# Altium schematic sheet FPGAPower&Misc.SchDoc: =DocumentName
size A3; EDA_Number: ARTIQ; Projet: ARTIQ/SINARA; ModifiedBy: -; CheckedDate: -; Title2: FPGA Power&Misc; DivGrp: WUT ISE; Designer: F.Świtakowski; DocumentNumber: 10; Revision: 0; SheetNumber: 10; SheetTotal: 17
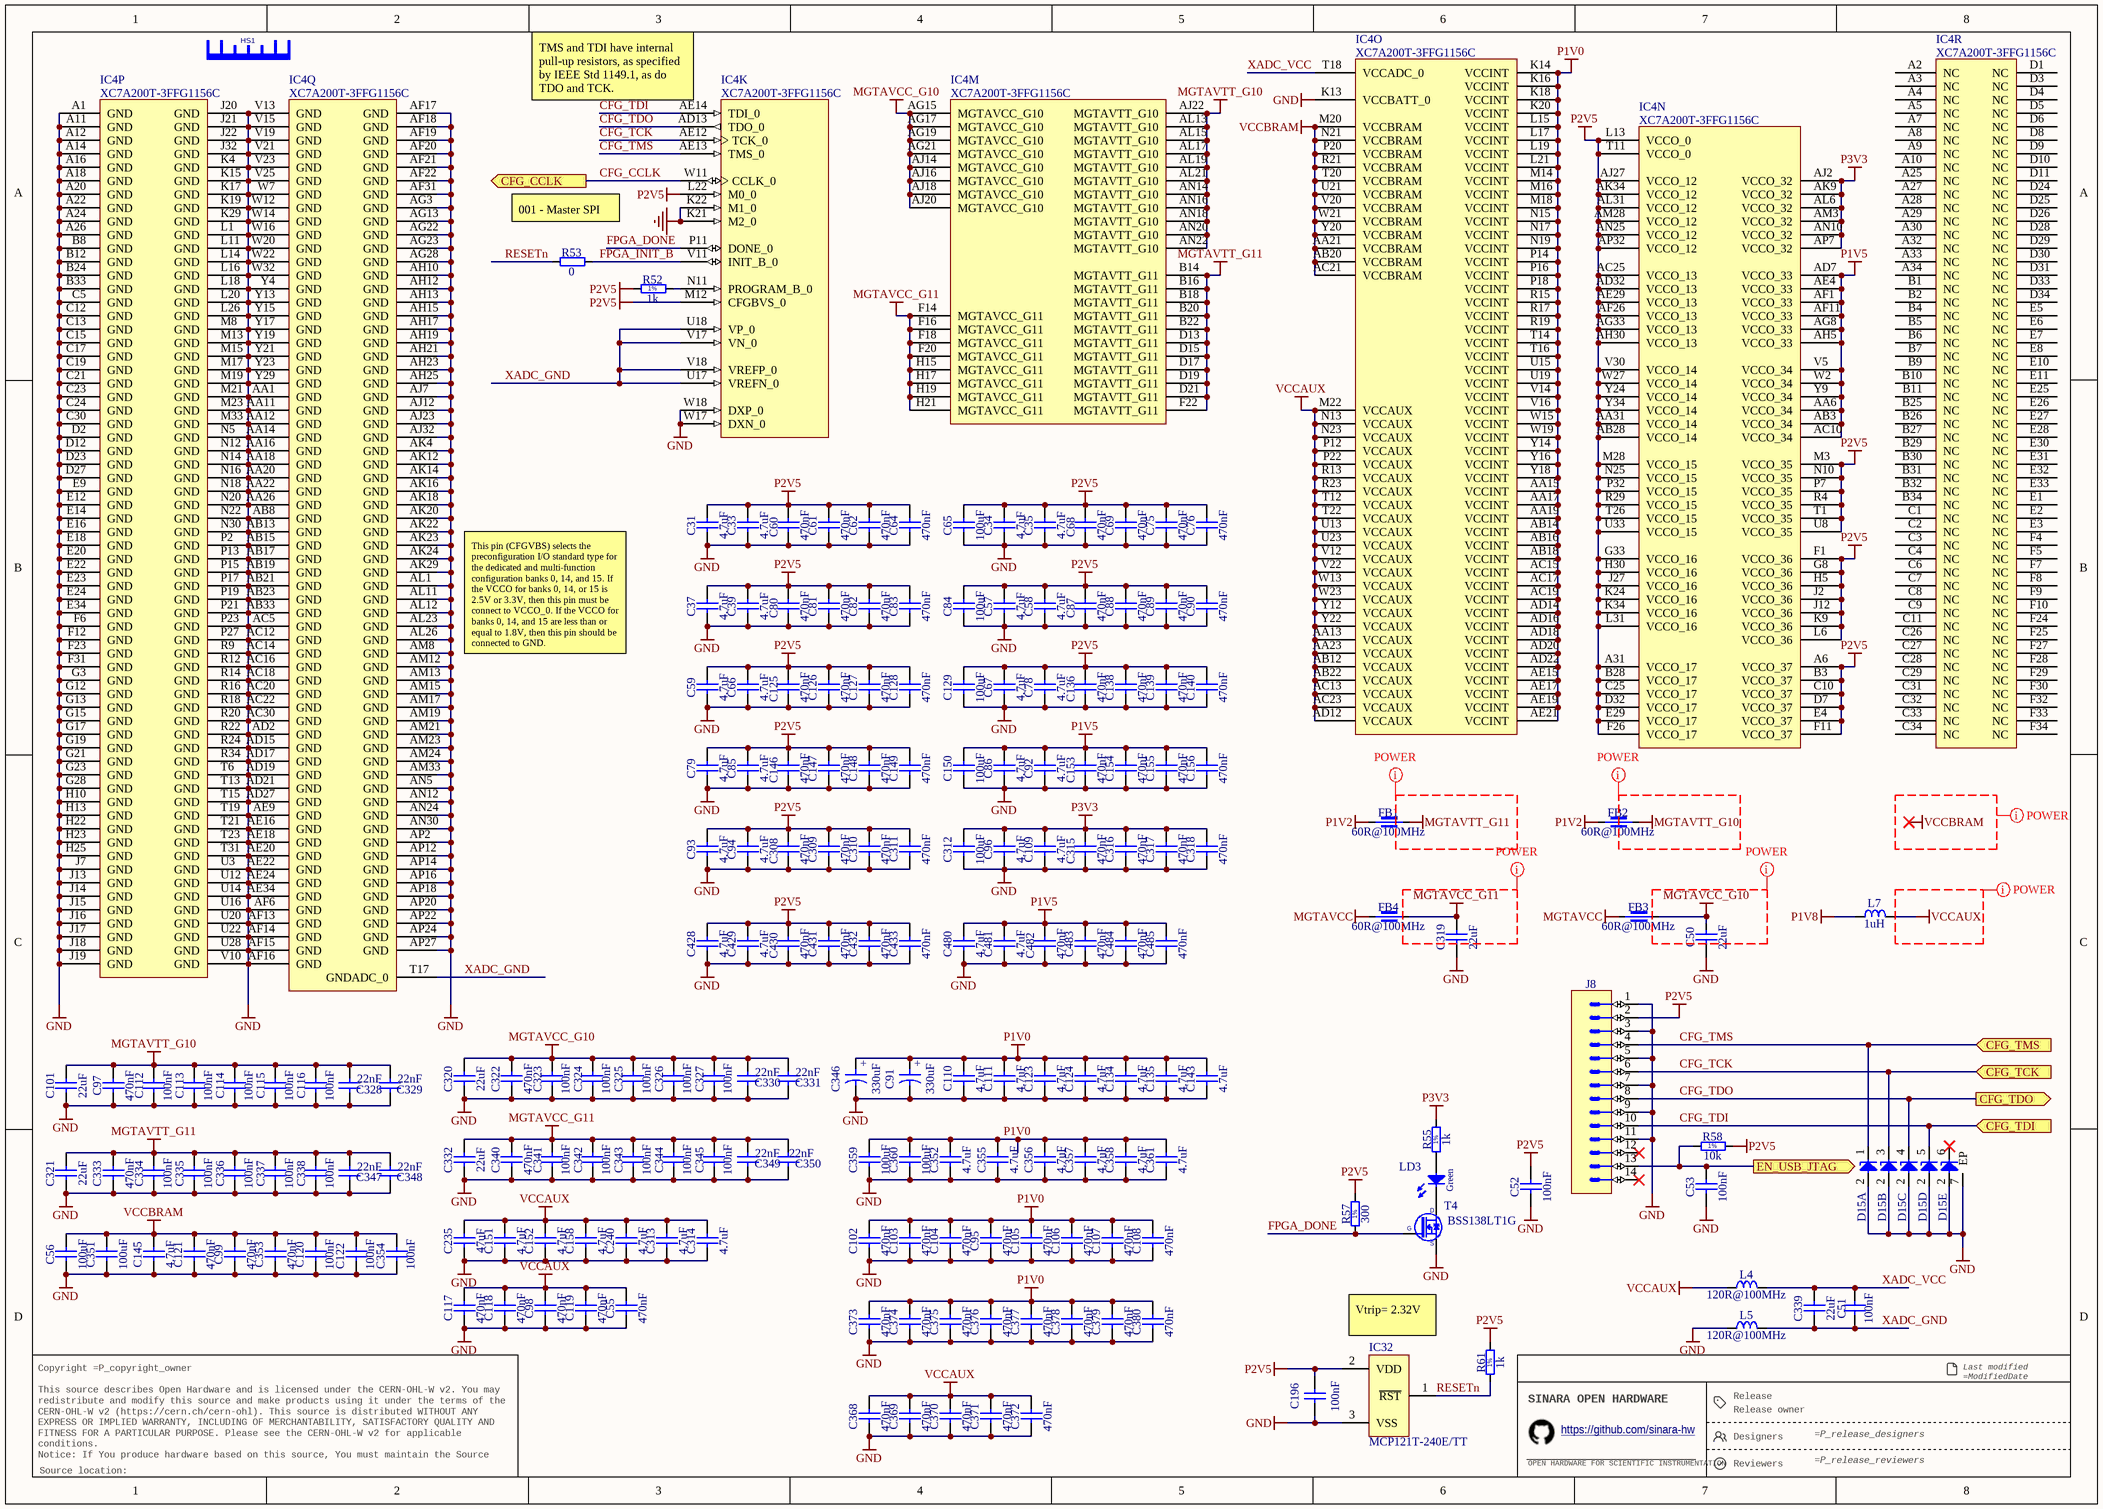
[diagram p0: FPGAPower&Misc.SchDoc]

## Parts
C31  4.7uF  [CAPC1005X55N]
C33  4.7uF  [CAPC1005X55N]
C34  4.7uF  [CAPC1005X55N]
C35  4.7uF  [CAPC1005X55N]
C37  4.7uF  [CAPC1005X55N]
C39  4.7uF  [CAPC1005X55N]
C50  22uF  [CAPC1608X90N]
C51  100nF  [CAPC0603X33N]
C52  100nF  [CAPC1005X55N]
C53  100nF  [CAPC1005X55N]
C55  470nF  [CAPC0603X33N]
C56  100uF  [CAPC3225X270N]
C57  4.7uF  [CAPC1005X55N]
C58  4.7uF  [CAPC1005X55N]
C59  4.7uF  [CAPC1005X55N]
C60  470nF  [CAPC0603X33N]
C61  470nF  [CAPC0603X33N]
C62  470nF  [CAPC0603X33N]
C64  470nF  [CAPC0603X33N]
C65  100uF  [CAPC3225X270N]
C66  4.7uF  [CAPC1005X55N]
C67  4.7uF  [CAPC1005X55N]
C68  470nF  [CAPC0603X33N]
C69  470nF  [CAPC0603X33N]
C75  470nF  [CAPC0603X33N]
C76  470nF  [CAPC0603X33N]
C78  4.7uF  [CAPC1005X55N]
C79  4.7uF  [CAPC1005X55N]
C80  470nF  [CAPC0603X33N]
C81  470nF  [CAPC0603X33N]
C82  470nF  [CAPC0603X33N]
C83  470nF  [CAPC0603X33N]
C84  100uF  [CAPC3225X270N]
C85  4.7uF  [CAPC1005X55N]
C86  4.7uF  [CAPC1005X55N]
C87  470nF  [CAPC0603X33N]
C88  470nF  [CAPC0603X33N]
C89  470nF  [CAPC0603X33N]
C90  470nF  [CAPC0603X33N]
C91  330uF  [CAPMP7343X190N]
C92  4.7uF  [CAPC1005X55N]
C93  4.7uF  [CAPC1005X55N]
C94  4.7uF  [CAPC1005X55N]
C95  470nF  [CAPC0603X33N]
C96  4.7uF  [CAPC1005X55N]
C97  470nF  [CAPC0603X33N]
C98  470nF  [CAPC0603X33N]
C99  470nF  [CAPC0603X33N]
C101  22uF  [CAPC1709X100N]
C102  470nF  [CAPC0603X33N]
C103  470nF  [CAPC0603X33N]
C104  470nF  [CAPC0603X33N]
C105  470nF  [CAPC0603X33N]
C106  470nF  [CAPC0603X33N]
C107  470nF  [CAPC0603X33N]
C108  470nF  [CAPC0603X33N]
C109  4.7uF  [CAPC1005X55N]
C110  4.7uF  [CAPC1005X55N]
C111  4.7uF  [CAPC1005X55N]
C112  100nF  [CAPC0603X33N]
C113  100nF  [CAPC0603X33N]
C114  100nF  [CAPC0603X33N]
C115  100nF  [CAPC0603X33N]
C116  100nF  [CAPC0603X33N]
C117  470nF  [CAPC0603X33N]
C118  470nF  [CAPC0603X33N]
C119  470nF  [CAPC0603X33N]
C120  100nF  [CAPC0603X33N]
C121  470nF  [CAPC0603X33N]
C122  100nF  [CAPC0603X33N]
C123  4.7uF  [CAPC1005X55N]
C124  4.7uF  [CAPC1005X55N]
C125  470nF  [CAPC0603X33N]
C126  470nF  [CAPC0603X33N]
C127  470nF  [CAPC0603X33N]
C128  470nF  [CAPC0603X33N]
C129  100uF  [CAPC3225X270N]
C134  4.7uF  [CAPC1005X55N]
C135  4.7uF  [CAPC1005X55N]
C136  470nF  [CAPC0603X33N]
C138  470nF  [CAPC0603X33N]
C139  470nF  [CAPC0603X33N]
C140  470nF  [CAPC0603X33N]
C143  4.7uF  [CAPC1005X55N]
C145  4.7uF  [CAPC1005X55N]
C146  470nF  [CAPC0603X33N]
C147  470nF  [CAPC0603X33N]
C148  470nF  [CAPC0603X33N]
C149  470nF  [CAPC0603X33N]
C150  100uF  [CAPC3225X270N]
C151  4.7uF  [CAPC1005X55N]
C152  4.7uF  [CAPC1005X55N]
C153  470nF  [CAPC0603X33N]
C154  470nF  [CAPC0603X33N]
C155  470nF  [CAPC0603X33N]
C156  470nF  [CAPC0603X33N]
C158  4.7uF  [CAPC1005X55N]
C196  100nF  [CAPC1005X55N]
C235  47uF  [CAPC3225X270N]
C240  4.7uF  [CAPC1005X55N]
C308  470nF  [CAPC0603X33N]
C309  470nF  [CAPC0603X33N]
C310  470nF  [CAPC0603X33N]
C311  470nF  [CAPC0603X33N]
C312  100uF  [CAPC3225X270N]
C313  4.7uF  [CAPC1005X55N]
C314  4.7uF  [CAPC1005X55N]
C315  470nF  [CAPC0603X33N]
C316  470nF  [CAPC0603X33N]
C317  470nF  [CAPC0603X33N]
C318  470nF  [CAPC0603X33N]
C319  22uF  [CAPC1608X90N]
C320  22uF  [CAPC1608X90N]
C321  22uF  [CAPC1608X90N]
C322  470nF  [CAPC0603X33N]
C323  100nF  [CAPC0603X33N]
C324  100nF  [CAPC0603X33N]
C325  100nF  [CAPC0603X33N]
C326  100nF  [CAPC0603X33N]
C327  100nF  [CAPC0603X33N]
C328  22nF  [CAPC0603X33N]
C329  22nF  [CAPC0603X33N]
C330  22nF  [CAPC0603X33N]
C331  22nF  [CAPC0603X33N]
C332  22uF  [CAPC1608X90N]
C333  470nF  [CAPC0603X33N]
C334  100nF  [CAPC0603X33N]
C335  100nF  [CAPC0603X33N]
C336  100nF  [CAPC0603X33N]
C337  100nF  [CAPC0603X33N]
C338  100nF  [CAPC0603X33N]
C339  22uF  [CAPC1608X90N]
C340  470nF  [CAPC0603X33N]
C341  100nF  [CAPC0603X33N]
C342  100nF  [CAPC0603X33N]
C343  100nF  [CAPC0603X33N]
C344  100nF  [CAPC0603X33N]
C345  100nF  [CAPC0603X33N]
C346  330uF  [CAPMP7343X190N]
C347  22nF  [CAPC0603X33N]
C348  22nF  [CAPC0603X33N]
C349  22nF  [CAPC0603X33N]
C350  22nF  [CAPC0603X33N]
C351  100uF  [CAPC3225X270N]
C352  4.7uF  [CAPC1005X55N]
C353  470nF  [CAPC0603X33N]
C354  100nF  [CAPC0603X33N]
C355  4.7uF  [CAPC1005X55N]
C356  4.7uF  [CAPC1005X55N]
C357  4.7uF  [CAPC1005X55N]
C358  4.7uF  [CAPC1005X55N]
C359  100uF  [CAPC3225X270N]
C360  100uF  [CAPC3225X270N]
C361  4.7uF  [CAPC1005X55N]
C368  470nF  [CAPC0603X33N]
C369  470nF  [CAPC0603X33N]
C370  470nF  [CAPC0603X33N]
C371  470nF  [CAPC0603X33N]
C372  470nF  [CAPC0603X33N]
C373  470nF  [CAPC0603X33N]
C374  470nF  [CAPC0603X33N]
C375  470nF  [CAPC0603X33N]
C376  470nF  [CAPC0603X33N]
C377  470nF  [CAPC0603X33N]
C378  470nF  [CAPC0603X33N]
C379  470nF  [CAPC0603X33N]
C380  470nF  [CAPC0603X33N]
C428  4.7uF  [CAPC1005X55N]
C429  4.7uF  [CAPC1005X55N]
C430  470nF  [CAPC0603X33N]
C431  470nF  [CAPC0603X33N]
C432  470nF  [CAPC0603X33N]
C433  470nF  [CAPC0603X33N]
C480  4.7uF  [CAPC1005X55N]
C481  4.7uF  [CAPC1005X55N]
C482  470nF  [CAPC0603X33N]
C483  470nF  [CAPC0603X33N]
C484  470nF  [CAPC0603X33N]
C485  470nF  [CAPC0603X33N]
D15  UCLAMP3305P.TCT  [SON50P160X65_HS-7N]  (value not drawn)  (parts A,B,C,D,E of 5)
FB1  60R@100MHz  [INDC4516X180N]
FB2  60R@100MHz  [INDC4516X180N]
FB3  60R@100MHz  [INDC4516X180N]
FB4  60R@100MHz  [INDC4516X180N]
HS1  Heat Sink No Pad  [HSINK_ATS_ATS-50350B-C1-R0]  (value not drawn)
IC4  XC7A200T-3FFG1156C  [BGA1156C100P34X34_3500X3500X310]  (parts K,M,N,O,P,Q,R of 18)
IC32  MCP121T-240E/TT  [SOT-23-TT3_L]
J8  Milli-Grid™  [MOLEX_87832-1420]  (value not drawn)
L4  120R@100MHz  [INDC1608X65N]
L5  120R@100MHz  [INDC1608X65N]
L7  1uH  [IND_BOURNS_SRN3015]
LD3  Green  [LED_KINGBRIGHT_KPH-1608CGCK]
R52  1k  [RESC1005X40N]
R53  0  [RESC1005X40N]
R55  1k  [RESC1005X40N]
R57  300  [RESC1005X40N]
R58  10k  [RESC1005X40N]
R61  1k  [RESC1005X40N]
T4  BSS138LT1G  [SOT95P240X110-3N]

## Ports
CFG_CCLK (out), CFG_TCK (in), CFG_TDI (in), CFG_TDO (out), CFG_TMS (in), EN_USB_JTAG (out)

## Nets
GND: C31.1 C33.1 C34.1 C35.1 C37.1 C39.1 C50.1 C52.1 C53.1 C55.1 C56.1 C57.1 C58.1 C59.1 C60.1 C61.1 C62.1 C64.1 C65.1 C66.1 C67.1 C68.1 C69.1 C75.1 C76.1 C78.1 C79.1 C80.1 C81.1 C82.1 C83.1 C84.1 C85.1 C86.1 C87.1 C88.1 C89.1 C90.1 C91.2 C92.1 C93.1 C94.1 C95.1 C96.1 C97.1 C98.1 C99.1 C101.1 C102.1 C103.1 C104.1 C105.1 C106.1 C107.1 C108.1 C109.1 C110.1 C111.1 C112.1 C113.1 C114.1 C115.1 C116.1 C117.1 C118.1 C119.1 C120.1 C121.1 C122.1 C123.1 C124.1 C125.1 C126.1 C127.1 C128.1 C129.1 C134.1 C135.1 C136.1 C138.1 C139.1 C140.1 C143.1 C145.1 C146.1 C147.1 C148.1 C149.1 C150.1 C151.1 C152.1 C153.1 C154.1 C155.1 C156.1 C158.1 C196.1 C235.1 C240.1 C308.1 C309.1 C310.1 C311.1 C312.1 C313.1 C314.1 C315.1 C316.1 C317.1 C318.1 C319.1 C320.1 C321.1 C322.1 C323.1 C324.1 C325.1 C326.1 C327.1 C328.1 C329.1 C330.1 C331.1 C332.1 C333.1 C334.1 C335.1 C336.1 C337.1 C338.1 C340.1 C341.1 C342.1 C343.1 C344.1 C345.1 C346.2 C347.1 C348.1 C349.1 C350.1 C351.1 C352.1 C353.1 C354.1 C355.1 C356.1 C357.1 C358.1 C359.1 C360.1 C361.1 C368.1 C369.1 C370.1 C371.1 C372.1 C373.1 C374.1 C375.1 C376.1 C377.1 C378.1 C379.1 C380.1 C428.1 C429.1 C430.1 C431.1 C432.1 C433.1 C480.1 C481.1 C482.1 C483.1 C484.1 C485.1 D15.2(A) D15.7(EP) IC4.A1(GND) IC4.A11(GND) IC4.A12(GND) IC4.A14(GND) IC4.A16(GND) IC4.A18(GND) IC4.A20(GND) IC4.A22(GND) IC4.A24(GND) IC4.A26(GND) IC4.AA1(GND) IC4.AA11(GND) IC4.AA12(GND) IC4.AA14(GND) IC4.AA16(GND) IC4.AA18(GND) IC4.AA20(GND) IC4.AA22(GND) IC4.AA26(GND) IC4.AB8(GND) IC4.AB13(GND) IC4.AB15(GND) IC4.AB17(GND) IC4.AB19(GND) IC4.AB21(GND) IC4.AB23(GND) IC4.AB33(GND) IC4.AC5(GND) IC4.AC12(GND) IC4.AC14(GND) IC4.AC16(GND) IC4.AC18(GND) IC4.AC20(GND) IC4.AC22(GND) IC4.AC30(GND) IC4.AD2(GND) IC4.AD15(GND) IC4.AD17(GND) IC4.AD19(GND) IC4.AD21(GND) IC4.AD27(GND) IC4.AE9(GND) IC4.AE16(GND) IC4.AE18(GND) IC4.AE20(GND) IC4.AE22(GND) IC4.AE24(GND) IC4.AE34(GND) IC4.AF6(GND) IC4.AF13(GND) IC4.AF14(GND) IC4.AF15(GND) IC4.AF16(GND) IC4.AF17(GND) IC4.AF18(GND) IC4.AF19(GND) IC4.AF20(GND) IC4.AF21(GND) IC4.AF22(GND) IC4.AF31(GND) IC4.AG3(GND) IC4.AG13(GND) IC4.AG22(GND) IC4.AG23(GND) IC4.AG28(GND) IC4.AH10(GND) IC4.AH12(GND) IC4.AH13(GND) IC4.AH15(GND) IC4.AH17(GND) IC4.AH19(GND) IC4.AH21(GND) IC4.AH23(GND) IC4.AH25(GND) IC4.AJ7(GND) IC4.AJ12(GND) IC4.AJ23(GND) IC4.AJ32(GND) IC4.AK4(GND) IC4.AK12(GND) IC4.AK14(GND) IC4.AK16(GND) IC4.AK18(GND) IC4.AK20(GND) IC4.AK22(GND) IC4.AK23(GND) IC4.AK24(GND) IC4.AK29(GND) IC4.AL1(GND) IC4.AL11(GND) IC4.AL12(GND) IC4.AL23(GND) IC4.AL26(GND) IC4.AM8(GND) IC4.AM12(GND) IC4.AM13(GND) IC4.AM15(GND) IC4.AM17(GND) IC4.AM19(GND) IC4.AM21(GND) IC4.AM23(GND) IC4.AM24(GND) IC4.AM33(GND) IC4.AN5(GND) IC4.AN12(GND) IC4.AN24(GND) IC4.AN30(GND) IC4.AP2(GND) IC4.AP12(GND) IC4.AP14(GND) IC4.AP16(GND) IC4.AP18(GND) IC4.AP20(GND) IC4.AP22(GND) IC4.AP24(GND) IC4.AP27(GND) IC4.B8(GND) IC4.B12(GND) IC4.B24(GND) IC4.B33(GND) IC4.C5(GND) IC4.C12(GND) IC4.C13(GND) IC4.C15(GND) IC4.C17(GND) IC4.C19(GND) IC4.C21(GND) IC4.C23(GND) IC4.C24(GND) IC4.C30(GND) IC4.D2(GND) IC4.D12(GND) IC4.D23(GND) IC4.D27(GND) IC4.E9(GND) IC4.E12(GND) IC4.E14(GND) IC4.E16(GND) IC4.E18(GND) IC4.E20(GND) IC4.E22(GND) IC4.E23(GND) IC4.E24(GND) IC4.E34(GND) IC4.F6(GND) IC4.F12(GND) IC4.F23(GND) IC4.F31(GND) IC4.G3(GND) IC4.G12(GND) IC4.G13(GND) IC4.G15(GND) IC4.G17(GND) IC4.G19(GND) IC4.G21(GND) IC4.G23(GND) IC4.G28(GND) IC4.H10(GND) IC4.H13(GND) IC4.H22(GND) IC4.H23(GND) IC4.H25(GND) IC4.J7(GND) IC4.J13(GND) IC4.J14(GND) IC4.J15(GND) IC4.J16(GND) IC4.J17(GND) IC4.J18(GND) IC4.J19(GND) IC4.J20(GND) IC4.J21(GND) IC4.J22(GND) IC4.J32(GND) IC4.K4(GND) IC4.K13(VCCBATT_0) IC4.K15(GND) IC4.K17(GND) IC4.K19(GND) IC4.K21(M2_0) IC4.K22(M1_0) IC4.K29(GND) IC4.L1(GND) IC4.L11(GND) IC4.L14(GND) IC4.L16(GND) IC4.L18(GND) IC4.L20(GND) IC4.L26(GND) IC4.M8(GND) IC4.M13(GND) IC4.M15(GND) IC4.M17(GND) IC4.M19(GND) IC4.M21(GND) IC4.M23(GND) IC4.M33(GND) IC4.N5(GND) IC4.N12(GND) IC4.N14(GND) IC4.N16(GND) IC4.N18(GND) IC4.N20(GND) IC4.N22(GND) IC4.N30(GND) IC4.P2(GND) IC4.P13(GND) IC4.P15(GND) IC4.P17(GND) IC4.P19(GND) IC4.P21(GND) IC4.P23(GND) IC4.P27(GND) IC4.R9(GND) IC4.R12(GND) IC4.R14(GND) IC4.R16(GND) IC4.R18(GND) IC4.R20(GND) IC4.R22(GND) IC4.R24(GND) IC4.R34(GND) IC4.T6(GND) IC4.T13(GND) IC4.T15(GND) IC4.T19(GND) IC4.T21(GND) IC4.T23(GND) IC4.T31(GND) IC4.U3(GND) IC4.U12(GND) IC4.U14(GND) IC4.U16(GND) IC4.U20(GND) IC4.U22(GND) IC4.U28(GND) IC4.V10(GND) IC4.V13(GND) IC4.V15(GND) IC4.V19(GND) IC4.V21(GND) IC4.V23(GND) IC4.V25(GND) IC4.W7(GND) IC4.W12(GND) IC4.W14(GND) IC4.W16(GND) IC4.W17(DXN_0) IC4.W18(DXP_0) IC4.W20(GND) IC4.W22(GND) IC4.W32(GND) IC4.Y4(GND) IC4.Y13(GND) IC4.Y15(GND) IC4.Y17(GND) IC4.Y19(GND) IC4.Y21(GND) IC4.Y23(GND) IC4.Y29(GND) IC32.3(VSS) J8.1 J8.3 J8.5 J8.7 J8.9 J8.11 L5.1 T4.2(S)
MGTAVCC: FB3.1 FB4.1
MGTAVCC_G10: C50.2 C320.2 C322.2 C323.2 C324.2 C325.2 C326.2 C327.2 C330.2 C331.2 FB3.2 IC4.AG15(MGTAVCC_G10) IC4.AG17(MGTAVCC_G10) IC4.AG19(MGTAVCC_G10) IC4.AG21(MGTAVCC_G10) IC4.AJ14(MGTAVCC_G10) IC4.AJ16(MGTAVCC_G10) IC4.AJ18(MGTAVCC_G10) IC4.AJ20(MGTAVCC_G10)
MGTAVCC_G11: C319.2 C332.2 C340.2 C341.2 C342.2 C343.2 C344.2 C345.2 C349.2 C350.2 FB4.2 IC4.F14(MGTAVCC_G11) IC4.F16(MGTAVCC_G11) IC4.F18(MGTAVCC_G11) IC4.F20(MGTAVCC_G11) IC4.H15(MGTAVCC_G11) IC4.H17(MGTAVCC_G11) IC4.H19(MGTAVCC_G11) IC4.H21(MGTAVCC_G11)
MGTAVTT_G10: C97.2 C101.2 C112.2 C113.2 C114.2 C115.2 C116.2 C328.2 C329.2 FB2.2 IC4.AJ22(MGTAVTT_G10) IC4.AL13(MGTAVTT_G10) IC4.AL15(MGTAVTT_G10) IC4.AL17(MGTAVTT_G10) IC4.AL19(MGTAVTT_G10) IC4.AL21(MGTAVTT_G10) IC4.AN14(MGTAVTT_G10) IC4.AN16(MGTAVTT_G10) IC4.AN18(MGTAVTT_G10) IC4.AN20(MGTAVTT_G10) IC4.AN22(MGTAVTT_G10)
MGTAVTT_G11: C321.2 C333.2 C334.2 C335.2 C336.2 C337.2 C338.2 C347.2 C348.2 FB1.2 IC4.B14(MGTAVTT_G11) IC4.B16(MGTAVTT_G11) IC4.B18(MGTAVTT_G11) IC4.B20(MGTAVTT_G11) IC4.B22(MGTAVTT_G11) IC4.D13(MGTAVTT_G11) IC4.D15(MGTAVTT_G11) IC4.D17(MGTAVTT_G11) IC4.D19(MGTAVTT_G11) IC4.D21(MGTAVTT_G11) IC4.F22(MGTAVTT_G11)
P1V0: C91.1 C95.2 C102.2 C103.2 C104.2 C105.2 C106.2 C107.2 C108.2 C110.2 C111.2 C123.2 C124.2 C134.2 C135.2 C143.2 C346.1 C352.2 C355.2 C356.2 C357.2 C358.2 C359.2 C360.2 C361.2 C373.2 C374.2 C375.2 C376.2 C377.2 C378.2 C379.2 C380.2 IC4.AA15(VCCINT) IC4.AA17(VCCINT) IC4.AA19(VCCINT) IC4.AB14(VCCINT) IC4.AB16(VCCINT) IC4.AB18(VCCINT) IC4.AC15(VCCINT) IC4.AC17(VCCINT) IC4.AC19(VCCINT) IC4.AD14(VCCINT) IC4.AD16(VCCINT) IC4.AD18(VCCINT) IC4.AD20(VCCINT) IC4.AD22(VCCINT) IC4.AE15(VCCINT) IC4.AE17(VCCINT) IC4.AE19(VCCINT) IC4.AE21(VCCINT) IC4.K14(VCCINT) IC4.K16(VCCINT) IC4.K18(VCCINT) IC4.K20(VCCINT) IC4.L15(VCCINT) IC4.L17(VCCINT) IC4.L19(VCCINT) IC4.L21(VCCINT) IC4.M14(VCCINT) IC4.M16(VCCINT) IC4.M18(VCCINT) IC4.N15(VCCINT) IC4.N17(VCCINT) IC4.N19(VCCINT) IC4.P14(VCCINT) IC4.P16(VCCINT) IC4.P18(VCCINT) IC4.R15(VCCINT) IC4.R17(VCCINT) IC4.R19(VCCINT) IC4.T14(VCCINT) IC4.T16(VCCINT) IC4.U15(VCCINT) IC4.U19(VCCINT) IC4.V14(VCCINT) IC4.V16(VCCINT) IC4.W15(VCCINT) IC4.W19(VCCINT) IC4.Y14(VCCINT) IC4.Y16(VCCINT) IC4.Y18(VCCINT)
P1V2: FB1.1 FB2.1
P1V5: C86.2 C92.2 C150.2 C153.2 C154.2 C155.2 C156.2 C480.2 C481.2 C482.2 C483.2 C484.2 C485.2 IC4.AA6(VCCO_34) IC4.AB3(VCCO_34) IC4.AC10(VCCO_34) IC4.AD7(VCCO_33) IC4.AE4(VCCO_33) IC4.AF1(VCCO_33) IC4.AF11(VCCO_33) IC4.AG8(VCCO_33) IC4.AH5(VCCO_33) IC4.V5(VCCO_34) IC4.W2(VCCO_34) IC4.Y9(VCCO_34)
P1V8: L7.1
P2V5: C31.2 C33.2 C34.2 C35.2 C37.2 C39.2 C52.2 C57.2 C58.2 C59.2 C60.2 C61.2 C62.2 C64.2 C65.2 C66.2 C67.2 C68.2 C69.2 C75.2 C76.2 C78.2 C79.2 C80.2 C81.2 C82.2 C83.2 C84.2 C85.2 C87.2 C88.2 C89.2 C90.2 C93.2 C94.2 C125.2 C126.2 C127.2 C128.2 C129.2 C136.2 C138.2 C139.2 C140.2 C146.2 C147.2 C148.2 C149.2 C196.2 C308.2 C309.2 C310.2 C311.2 C428.2 C429.2 C430.2 C431.2 C432.2 C433.2 IC4.A6(VCCO_37) IC4.A31(VCCO_17) IC4.AA31(VCCO_14) IC4.AB28(VCCO_14) IC4.AC25(VCCO_13) IC4.AD32(VCCO_13) IC4.AE29(VCCO_13) IC4.AF26(VCCO_13) IC4.AG33(VCCO_13) IC4.AH30(VCCO_13) IC4.AJ27(VCCO_12) IC4.AK34(VCCO_12) IC4.AL31(VCCO_12) IC4.AM28(VCCO_12) IC4.AN25(VCCO_12) IC4.AP32(VCCO_12) IC4.B3(VCCO_37) IC4.B28(VCCO_17) IC4.C10(VCCO_37) IC4.C25(VCCO_17) IC4.D7(VCCO_37) IC4.D32(VCCO_17) IC4.E4(VCCO_37) IC4.E29(VCCO_17) IC4.F1(VCCO_36) IC4.F11(VCCO_37) IC4.F26(VCCO_17) IC4.G8(VCCO_36) IC4.G33(VCCO_16) IC4.H5(VCCO_36) IC4.H30(VCCO_16) IC4.J2(VCCO_36) IC4.J12(VCCO_36) IC4.J27(VCCO_16) IC4.K9(VCCO_36) IC4.K24(VCCO_16) IC4.K34(VCCO_16) IC4.L6(VCCO_36) IC4.L13(VCCO_0) IC4.L22(M0_0) IC4.L31(VCCO_16) IC4.M3(VCCO_35) IC4.M12(CFGBVS_0) IC4.M28(VCCO_15) IC4.N10(VCCO_35) IC4.N25(VCCO_15) IC4.P7(VCCO_35) IC4.P32(VCCO_15) IC4.R4(VCCO_35) IC4.R29(VCCO_15) IC4.T1(VCCO_35) IC4.T11(VCCO_0) IC4.T26(VCCO_15) IC4.U8(VCCO_35) IC4.U33(VCCO_15) IC4.V30(VCCO_14) IC4.W27(VCCO_14) IC4.Y24(VCCO_14) IC4.Y34(VCCO_14) IC32.2(VDD) J8.2 R52.1 R57.2 R58.2 R61.2
P3V3: C96.2 C109.2 C312.2 C315.2 C316.2 C317.2 C318.2 IC4.AJ2(VCCO_32) IC4.AK9(VCCO_32) IC4.AL6(VCCO_32) IC4.AM3(VCCO_32) IC4.AN10(VCCO_32) IC4.AP7(VCCO_32) R55.2
VCCAUX: C55.2 C98.2 C117.2 C118.2 C119.2 C151.2 C152.2 C158.2 C235.2 C240.2 C313.2 C314.2 C368.2 C369.2 C370.2 C371.2 C372.2 IC4.AA13(VCCAUX) IC4.AA23(VCCAUX) IC4.AB12(VCCAUX) IC4.AB22(VCCAUX) IC4.AC13(VCCAUX) IC4.AC23(VCCAUX) IC4.AD12(VCCAUX) IC4.M22(VCCAUX) IC4.N13(VCCAUX) IC4.N23(VCCAUX) IC4.P12(VCCAUX) IC4.P22(VCCAUX) IC4.R13(VCCAUX) IC4.R23(VCCAUX) IC4.T12(VCCAUX) IC4.T22(VCCAUX) IC4.U13(VCCAUX) IC4.U23(VCCAUX) IC4.V12(VCCAUX) IC4.V22(VCCAUX) IC4.W13(VCCAUX) IC4.W23(VCCAUX) IC4.Y12(VCCAUX) IC4.Y22(VCCAUX) L4.1 L7.2
VCCBRAM: C56.2 C99.2 C120.2 C121.2 C122.2 C145.2 C351.2 C353.2 C354.2 IC4.AA21(VCCBRAM) IC4.AB20(VCCBRAM) IC4.AC21(VCCBRAM) IC4.M20(VCCBRAM) IC4.N21(VCCBRAM) IC4.P20(VCCBRAM) IC4.R21(VCCBRAM) IC4.T20(VCCBRAM) IC4.U21(VCCBRAM) IC4.V20(VCCBRAM) IC4.W21(VCCBRAM) IC4.Y20(VCCBRAM)
CFG_CCLK: IC4.W11(CCLK_0) ; port CFG_CCLK
CFG_TCK: D15.3(C) IC4.AE12(TCK_0) J8.6 ; port CFG_TCK
CFG_TDI: D15.5(C) IC4.AE14(TDI_0) J8.10 ; port CFG_TDI
CFG_TDO: D15.4(C) IC4.AD13(TDO_0) J8.8 ; port CFG_TDO
CFG_TMS: D15.1(C) IC4.AE13(TMS_0) J8.4 ; port CFG_TMS
EN_USB_JTAG: C53.2 J8.13 R58.1 ; port EN_USB_JTAG
FPGA_DONE: IC4.P11(DONE_0) R57.1 T4.1(G)
FPGA_INIT_B: IC4.V11(INIT_B_0) R53.2
RESETn: IC32.1(~{RST}) R53.1 R61.1
XADC_GND: C51.1 C339.1 IC4.T17(GNDADC_0) IC4.U17(VREFN_0) IC4.U18(VP_0) IC4.V17(VN_0) IC4.V18(VREFP_0) L5.2
XADC_VCC: C51.2 C339.2 IC4.T18(VCCADC_0) L4.2
NetIC4_N11: IC4.N11(PROGRAM_B_0) R52.2
NetLD3_1: LD3.1(C) T4.3(D)
NetLD3_2: LD3.2(A) R55.1

Not connected (* = marked no-connect by the designer): D15 6(C)*; IC4 A2(NC) A3(NC) A4(NC) A5(NC) A7(NC) A8(NC) A9(NC) A10(NC) A25(NC) A27(NC) A28(NC) A29(NC) A30(NC) A32(NC) A33(NC) A34(NC) B1(NC) B2(NC) B4(NC) B5(NC) B6(NC) B7(NC) B9(NC) B10(NC) B11(NC) B25(NC) B26(NC) B27(NC) B29(NC) B30(NC) B31(NC) B32(NC) B34(NC) C1(NC) C2(NC) C3(NC) C4(NC) C6(NC) C7(NC) C8(NC) C9(NC) C11(NC) C26(NC) C27(NC) C28(NC) C29(NC) C31(NC) C32(NC) C33(NC) C34(NC) D1(NC) D3(NC) D4(NC) D5(NC) D6(NC) D8(NC) D9(NC) D10(NC) D11(NC) D24(NC) D25(NC) D26(NC) D28(NC) D29(NC) D30(NC) D31(NC) D33(NC) D34(NC) E1(NC) E2(NC) E3(NC) E5(NC) E6(NC) E7(NC) E8(NC) E10(NC) E11(NC) E25(NC) E26(NC) E27(NC) E28(NC) E30(NC) E31(NC) E32(NC) E33(NC) F4(NC) F5(NC) F7(NC) F8(NC) F9(NC) F10(NC) F24(NC) F25(NC) F27(NC) F28(NC) F29(NC) F30(NC) F32(NC) F33(NC) F34(NC); J8 12* 14*

## Layout directives
net class POWER: MGTAVCC_G10, MGTAVCC_G11, MGTAVTT_G10, MGTAVTT_G11, VCCAUX, VCCBRAM

## Notes on the sheet
- (near IC4) TMS and TDI have internal pull-up resistors, as specified by IEEE Std 1149.1, as do TDO and TCK.
- (near R53) 001 - Master SPI
- This pin (CFGVBS) selects the preconfiguration I/O standard type for the dedicated and multi-function configuration banks 0, 14, and 15. If the VCCO for banks 0, 14, or 15 is 2.5V or 3.3V, then this pin must be connect to VCCO_0. If the VCCO for banks 0, 14, and 15 are less than or equal to 1.8V, then this pin should be connected to GND.
- (near IC32) Vtrip= 2.32V
- Labels drawn without touching a wire or pin: VCCBRAM
- Release
- Last modified =ModifiedDate
  Sheet =sheetnumber of =sheettotal · Size A3
- Copyright =P_copyright_owner
  This source describes Open Hardware and is licensed under the CERN-OHL-W v2. You may redistribute and modify this source and make products using it under the terms of the CERN-OHL-W v2 (https://cern.ch/cern-ohl). This source is distributed WITHOUT ANY EXPRESS OR IMPLIED WARRANTY, INCLUDING OF MERCHANTABILITY, SATISFACTORY QUALITY AND FITNESS FOR A PARTICULAR PURPOSE. Please see the CERN-OHL-W v2 for applicable conditions.
  Notice: If You produce hardware based on this source, You must maintain the Source Location visible on the product, its packaging or its documentation.
- SINARA OPEN HARDWARE
- OPEN HARDWARE FOR SCIENTIFIC INSTRUMENTATION
- https://github.com/sinara-hw
- Release owner
- Designers
- Reviewers
- Source location:
- (in symbol CTE7343-19_330UF_2.5V_20%_LESR0025_KEMET_T520) +
- (in symbol R0402_1K_1%_0.0625W_100PPM) 1%
- (in symbol R0402_1k_1%_0.0625W_100PPM) 1%
- (in symbol R0402_10K_1%_0.0625W_100PPM) 1%
- (in symbol R0402_300R_1%_0.0625W_100PPM) 1%

## Library data of the parts
C31 C33-C35 C37 C39 C57-C59 C66 C67 C78 C79 C85 C86 C92-C94 C96 C109-C111 C123 C124 C134 C135 C143 C145 C151 C152 C158 C240 C313 C314 C352 C355-C358 C361 C428 C429 C480 C481 = CC0402_4.7UF_6.3V_20%_X5R: Non-polarised capacitor; Part Description: SMD Multilayer Chip Ceramic Capacitor; Manufacturer: GENERIC; Manufacturer1 Part Number: C1005X5R0J475M050; Voltage: 6.3V; TC: X5R; Tolerance: ±20%; Part Number: CC0402_4.7UF_6.3V_20%_X5R; Component Kind: Standard; Component Type: Standard; Pin Count: 2; Value: 4.7uF; Status: Preferred; Manufacturer Part Number: CC0402_4.7UF_6.3V_20%_X5R; Case: 0402; Mounted: Yes; Socket: No; SMD: Yes; Sense: No; Manufacturer1 Example: TDK; Manufacturer1 ComponentHeight: 0.65mm; HelpURL: \\cern.ch\dfs\Applications\Altium\Datasheets\CC0402_X5R_TDK_C.pdf; Author: CERN DEM JLC; CreateDate: 03.03.2015; LatestRevisionDate: 03.03.2015
C50 C319-C321 C332 C339 = CC0603_22UF_6.3V_20%_X5R: Non-polarised capacitor; Part Description: SMD Multilayer Chip Ceramic Capacitor; Manufacturer: GENERIC; Manufacturer1 Part Number: C1608X5R0J226M080; Voltage: 6.3V; TC: X5R; Tolerance: ±20%; Part Number: CC0603_22UF_6.3V_20%_X5R; Component Kind: Standard; Component Type: Standard; Pin Count: 2; Value: 22uF; Status: None; Manufacturer Part Number: CC0603_22UF_6.3V_20%_X5R; Case: 0603; Mounted: Yes; Socket: No; SMD: Yes; Sense: No; Manufacturer1 Example: TDK; Manufacturer1 ComponentHeight: 0.9mm; HelpURL: \\cern.ch\dfs\Applications\Altium\Datasheets\CC0603_X5R_TDK_C.pdf; Author: CERN DEM JLC; CreateDate: 16.12.2013; LatestRevisionDate: 03.12.2020
C51 C112-C116 C120 C122 C323-C327 C334-C338 C341-C345 C354 = CC0201_100NF_6.3V_10%_X5R: Non-polarised capacitor; Part Description: SMD Multilayer Chip Ceramic Capacitor; Manufacturer: GENERIC; Manufacturer1 Part Number: 02016D104KAT2A; Voltage: 6.3V; TC: X5R; Tolerance: ±10%; Part Number: CC0201_100NF_6.3V_10%_X5R; Component Kind: Standard; Component Type: Standard; Pin Count: 2; Value: 100nF; Status: Not Recommended; Manufacturer Part Number: CC0201_100NF_6.3V_10%_X5R; Case: 0201; Mounted: Yes; Socket: No; SMD: Yes; Sense: No; Manufacturer1 Example: AVX; Manufacturer1 ComponentHeight: 0.33mm; HelpURL: \\cern.ch\dfs\Applications\Altium\Datasheets\CC0201_X5R_AVX.pdf; Author: CERN DEM JLC; CreateDate: 2007-12-03; LatestRevisionDate: 2007-12-03; ClassName: Artix
C52 C53 C196 = CC0402_100NF_16V_10%_X7R: Non-polarised capacitor; Part Description: SMD Multilayer Chip Ceramic Capacitor; Manufacturer: GENERIC; Manufacturer1 Part Number: GRM155R71C104KA88D; Voltage: 16V; TC: X7R; Tolerance: ±10%; Part Number: CC0402_100NF_16V_10%_X7R; Component Kind: Standard; Component Type: Standard; Pin Count: 2; Value: 100nF; Status: Not Recommended; Manufacturer Part Number: CC0402_100NF_16V_10%_X7R; Case: 0402; Mounted: Yes; Socket: No; SMD: Yes; Sense: No; Manufacturer1 Example: MURATA; Manufacturer1 ComponentHeight: 0.55mm; HelpURL: \\cern.ch\dfs\Applications\Altium\Datasheets\CC0402_X7R_MURATA_GRM.pdf; Author: CERN DEM JLC; CreateDate: 05/12/2013; LatestRevisionDate: 03/12/2007
C55 C60-C62 C64 C68 C69 C75 C76 C80-C83 C87-C90 C95 C97-C99 C102-C108 C117-C119 C121 C125-C128 C136 C138-C140 C146-C149 C153-C156 C308-C311 C315-C318 C322 C333 C340 C353 C368-C380 C430-C433 C482-C485 = CC0201_470NF_4V_20%_X5R: Non-polarised capacitor; Part Description: SMD Multilayer Chip Ceramic Capacitor; Manufacturer: GENERIC; Manufacturer1 Part Number: AMK063BJ474MP-F; Voltage: 4V; TC: X5R; Tolerance: ±20%; Part Number: CC0201_470NF_4V_20%_X5R; Component Kind: Standard; Component Type: Standard; Pin Count: 2; Value: 470nF; Status: Not Recommended; Manufacturer Part Number: CC0201_470NF_4V_20%_X5R; Case: 0201; Mounted: Yes; Socket: No; SMD: Yes; Sense: No; Manufacturer1 Example: TAIYO YUDEN; Manufacturer1 ComponentHeight: 0.33mm; HelpURL: \\cern.ch\dfs\Applications\Altium\Datasheets\CC0201_X5R_TAIYO-YUDEN_STANDARD-CLASS2.pdf; Author: CERN DEM JLC; CreateDate: 27.05.2010; LatestRevisionDate: 27.05.2010
  C61 C69 C81 C88 C95 C97-C99 C126 C138 C147 C154 C309 C316 C322 C333 C340 C353 C370 C376 C431 C483: ClassName: Artix
C56 C65 C84 C129 C150 C312 C351 C359 C360 = CC1210_100UF_6.3V_20%_X5R: Non-polarised capacitor; Part Description: SMD Multilayer Chip Ceramic Capacitor; Manufacturer: GENERIC; Manufacturer1 Part Number: GRM32ER60J107ME20L; Voltage: 6.3V; TC: X5R; Tolerance: ±20%; Part Number: CC1210_100UF_6.3V_20%_X5R; Component Kind: Standard; Component Type: Standard; Pin Count: 2; Value: 100uF; Status: Preferred; Manufacturer Part Number: CC1210_100UF_6.3V_20%_X5R; Case: 1210; Mounted: Yes; Socket: No; SMD: Yes; Sense: No; Manufacturer1 Example: MURATA; Manufacturer1 ComponentHeight: 2.7mm; HelpURL: \\cern.ch\dfs\Applications\Altium\Datasheets\CC1210_X5R_MURATA.pdf; Author: CERN DEM JLC; CreateDate: 19.04.2010; LatestRevisionDate: 19.04.2010
C91 C346 = CTE7343-19_330UF_2.5V_20%_LESR0025_KEMET_T520: Polarised capacitor; Part Description: Low ESR 0R025 Tantalum Chip Capacitor; Manufacturer: KEMET; Manufacturer Part Number: T520V337M2R5ATE025; Voltage: 2.5V; Tolerance: ±20%; Part Number: CTE7343-19_330UF_2.5V_20%_LESR0025_KEMET_T520; Component Kind: Standard; Component Type: Standard; Pin Count: 2; Value: 330uF; Status: None; Case: V; Mounted: Yes; Socket: No; SMD: Yes; Sense: No; ComponentHeight: 1.9mm; HelpURL: \\cern.ch\dfs\Applications\Altium\Datasheets\CTE-LESR_KEMET_T520.pdf; Author: CERN DEM MR; CreateDate: 23.03.2016; LatestRevisionDate: 23.03.2016
C101 = CC0603_22UF_6.3V_20%_X5R: Non-polarised capacitor; Part Description: SMD Multilayer Chip Ceramic Capacitor; Manufacturer: GENERIC; Manufacturer1 Part Number: C1608X5R0J226M080AC; Voltage: 6.3V; TC: X5R; Tolerance: ±20%; Part Number: CC0603_22UF_6.3V_20%_X5R; Component Kind: Standard; Component Type: Standard; Pin Count: 2; Value: 22uF; Status: None; Manufacturer Part Number: CC0603_22UF_6.3V_20%_X5R; Case: 0603; Mounted: Yes; Socket: No; SMD: Yes; Sense: No; Manufacturer1 Example: TDK; Manufacturer1 ComponentHeight: 1mm; HelpURL: \\cern.ch\dfs\Applications\Altium\Datasheets\CC0603_X5R_TDK_C.pdf; Author: CERN DEM JLC; CreateDate: 16.12.2013; LatestRevisionDate: 13.09.2016; ClassName: Artix
C235 = CC1210_47UF_10V_10%_X7R: Non-polarised capacitor; Part Description: SMD Multilayer Chip Ceramic Capacitor; Manufacturer: GENERIC; Manufacturer1 Part Number: GRM32ER71A476KE15; Voltage: 10V; TC: X7R; Tolerance: ±10%; Part Number: CC1210_47UF_10V_10%_X7R; Component Kind: Standard; Component Type: Standard; Pin Count: 2; Value: 47uF; Status: None; Manufacturer Part Number: CC1210_47UF_10V_10%_X7R; Case: 1210; Mounted: Yes; Socket: No; SMD: Yes; Sense: No; Manufacturer1 Example: MURATA; Manufacturer1 ComponentHeight: 2.7mm; HelpURL: \\cern.ch\dfs\Applications\Altium\Datasheets\CC1210_X7R_MURATA.pdf; Author: CERN DEM BC; CreateDate: 18.11.2015; LatestRevisionDate: 18.11.2015
C328-C331 C347-C350 = CC0201_22NF_6.3V_10%_X5R: Non-polarised capacitor; Part Description: SMD Multilayer Chip Ceramic Capacitor; Manufacturer: GENERIC; Manufacturer1 Part Number: 02016D223KAT2A; Voltage: 6.3V; TC: X5R; Tolerance: ±10%; Table: Capacitors SMD; Part Number: CC0201_22NF_6.3V_10%_X5R; Component Kind: Standard; Component Type: Standard; Pin Count: 2; Value: 22nF; Status: Not Recommended; Manufacturer Part Number: CC0201_22NF_6.3V_10%_X5R; Case: 0201; Mounted: Yes; Socket: No; SMD: Yes; Manufacturer1 Example: AVX; Manufacturer1 ComponentHeight: 0.33mm; HelpURL: \\cern.ch\dfs\Applications\Altium\Datasheets\CC0201_X5R_AVX.pdf; Author: CERN DEM JLC; CreateDate: 2007-12-03; LatestRevisionDate: 2007-12-03
D15 = CMP-004-00037-2: Diode TVS Quint Common Anode Uni-Dir 3.3V 40W 6-Pin SLP EP T/R; Max Operating Temperature: 125°C; Min Operating Temperature: -55°C; Pins: 6; Mounting Technology: Surface Mount
FB1-FB4 = IND1806_MURATA_BLM41PG600SN1L: Part Description: SMD EMI Suppression Chip Ferrite Bead (BLM41P Series); Manufacturer: MURATA; Power: 6A; Resistance: 0.01R; Part Number: IND1806_MURATA_BLM41PG600SN1L; Component Kind: Standard; Component Type: Standard; Pin Count: 2; Value: 60R@100MHz; Status: None; Manufacturer Part Number: BLM41PG600SN1L; Case: 1806; Mounted: Yes; Socket: No; SMD: Yes; Sense: No; ComponentHeight: 1.8mm; HelpURL: \\cern.ch\dfs\Applications\Altium\Datasheets\IND1806_MURATA_BLM41P.pdf; Author: CERN DEM JLC; CreateDate: 02.12.2009; LatestRevisionDate: 02.12.2009
HS1 = HSINK_ATS_ATS-50350B-C1-R0: Heat Sink Without Pad; Part Description: 35.0 x 35.0 x 7.5 mm BGA Heat Sink, High Performance maxiFLOW/maxiGRIP-STD; Manufacturer: ADVANCED THERMAL SOLUTIONS (ATS); PressFit: No; Part Number: HSINK_ATS_ATS-50350B-C1-R0; Component Kind: Accessories; Component Type: Standard; Pin Count: 0; PackageDescription: 35.0 x 35.0 x 7.5 mm BGA Heat Sink, Body 49.9mm x 35mm  Height 7.5mm; Mounted: Yes; Socket: No; SMD: No; Sense: No; Status: None; Manufacturer Part Number: ATS-50350B-C1-R0; ComponentHeight: 7.5mm; HelpURL: \\cern.ch\dfs\Applications\Altium\Datasheets\HSINK_ATS_ATS-50350B-C1-R0.pdf; Author: CERN DEM JLC; CreateDate: 30.11.2016; LatestRevisionDate: 30.11.2016
IC4 = XC7A200T-3FFG1156C: Artix-7 FPGA, 500 User I/Os, 16 GTP, 1156-Ball BGA, , Speed Grade 3, Commercial Grade, Pb-Free; Part Description: Artix-7 FPGA, 500 User I/Os, 16 GTP, 1156-Ball BGA, Speed Grade 3, Commercial Grade, Pb-Free; Manufacturer: XILINX; PressFit: No; Bonding: No; Part Number: XC7A200T-3FFG1156C; Component Kind: Standard; Component Type: Standard; Device: XC7A200T-3FFG1156C; PackageDescription: BGA, 1.00mm Pitch, Square; 1156 Pin, 34 Columns X 34 Rows, Body 35.00mm X 35.0mm X 3.10mm H, IPC Medium Density; Manufacturer Part Number: XC7A200T-3FFG1156C; Pin Count: 1156; Case: BGA1156; Mounted: Yes; Socket: No; SMD: Yes; Sense: No; ComponentHeight: 3.1mm; HelpURL: \\cern.ch\dfs\Applications\Altium\Datasheets\XC7A200T-3FFG1156C.pdf; ComponentLink1URL: \\cern.ch\dfs\Applications\Altium\Datasheets\XC7A200T-3FFG1156C_Package.pdf; ComponentLink1Description: Package; ComponentLink2URL: \\cern.ch\dfs\Applications\Altium\Datasheets\XC7A200T-3FFG1156C_Pinout.txt; ComponentLink2Description: Pinout; Author: CERN DEM JLC; CreateDate: 07.11.2016; LatestRevisionDate: 07.11.2016
IC32 = CMP-0138-00394-1: Micropower Voltage Supervisors, 3-Pin SOT-23, Extended Temperature, Tape and Reel; PackageReference: SOT-23-TT3; DatasheetVersion: revB, Mar-2005; PackageDescription: 3-Lead Plastic Small Outline Transistor (TT) [SOT-23]; Code_IPC: SOT23-3; PackageVersion: revBB, Aug-2009
J8 = MOLEX_87832-1420: Connector 14 Male; Part Description: 2.00mm (.079") Pitch Milli-Grid™ Header, Surface Mount, Vertical, Shrouded, 14 Circuits,with Locking Windows and Centre Polarization Slot, PCB Locator; Manufacturer: MOLEX; PressFit: No; Part Number: MOLEX_87832-1420; Component Kind: Standard; Component Type: Standard; Pin Count: 14; Family: Milli-Grid™; Mounted: Yes; Socket: No; SMD: Yes; Sense: No; Status: None; Manufacturer Part Number: 87832-1420; ComponentHeight: 7.6mm; HelpURL: \\cern.ch\dfs\Applications\Altium\Datasheets\MOLEX_87832-1420.pdf; Author: CERN DEM JLC; CreateDate: 09.09.2008; LatestRevisionDate: 09.09.2008
L4 L5 = IND0603_MURATA_BLM18SG121TN1D: Inductor; Part Description: SMD EMIFIL Suppression Chip Ferrite Bead; Manufacturer: MURATA; Power: 3A; Resistance: 0.025R; Tolerance: ±25%; Part Number: IND0603_MURATA_BLM18SG121TN1D; Component Kind: Standard; Component Type: Standard; Pin Count: 2; Value: 120R@100MHz; Status: None; Manufacturer Part Number: BLM18SG121TN1D; Case: 0603; Mounted: Yes; Socket: No; SMD: Yes; Sense: No; ComponentHeight: 0.65mm; HelpURL: \\cern.ch\dfs\Applications\Altium\Datasheets\IND0603_MURATA_BLM18S.pdf; Author: CERN DEM JLC; CreateDate: 23.07.2014; LatestRevisionDate: 23.07.2014; ClassName: Artix
L7 = IND_1UH_30%_BOURNS_SRN3015: Inductor; Part Description: Semi-Shielded SMD Power Inductor; Manufacturer: BOURNS; Manufacturer Part Number: SRN3015-1R0Y; Power: 2.35A; Resistance: 0.048R; Tolerance: ±30%; Part Number: IND_1UH_30%_BOURNS_SRN3015; Component Kind: Standard; Component Type: Standard; Pin Count: 2; Value: 1uH; Mounted: Yes; Socket: No; SMD: Yes; Sense: No; ComponentHeight: 1.5mm; HelpURL: \\cern.ch\dfs\Applications\Altium\Datasheets\IND_BOURNS_SRN3015.pdf; Author: CERN DEM JLC; CreateDate: 03.02.2015; LatestRevisionDate: 03.02.2015
LD3 = LED_KINGBRIGHT_KPH-1608CGCK: LED Green 1C 2A; Part Description: SMD Green LED, Case 1.6mmX0.8mm(0603), 0.65mm Thickness; PressFit: No; Bonding: No; Manufacturer Part Number: KPH-1608CGCK; ComponentHeight: 0.65mm; HelpURL: \\cern.ch\dfs\Applications\Altium\Datasheets\LED_KINGBRIGHT_KPH-1608CGCK.pdf; Part Number: LED_KINGBRIGHT_KPH-1608CGCK; Component Kind: Standard; Component Type: Standard; Color: Green; PackageDescription: SMT Green LED, Case 0603, Body L 1.6 x W 0.8mm H 0.65mm; Manufacturer: KINGBRIGHT; Pin Count: 2; Mounted: Yes; Socket: No; SMD: Yes; Sense: No; Author: CERN DEM JLC; CreateDate: 03.07.2017; LatestRevisionDate: 03.07.2017
R52 R61 = R0402_1K_1%_0.0625W_100PPM: Resistor - 1%; Part Description: General Purpose Thick Film Chip Resistor; Manufacturer: GENERIC; Manufacturer1 Part Number: 232270671002L; TC: ±100ppm/°C; PressFit: No; Part Number: R0402_1K_1%_0.0625W_100PPM; Component Kind: Standard; Component Type: Standard; Pin Count: 2; Value: 1k; Status: Not Recommended; Power: 0.0625W; Tolerance: ±1%; Manufacturer Part Number: R0402_1K_1%_0.0625W_100PPM; Case: 0402; Mounted: Yes; Sense: No; Socket: No; SMD: Yes; Manufacturer1 Example: YAGEO PHYCOMP; Manufacturer1 ComponentHeight: 0.4mm; HelpURL: \\cern.ch\dfs\Applications\Altium\Datasheets\R0402_Phycomp_RC0402.pdf; Author: CERN DEM JLC; CreateDate: 03.12.2007; LatestRevisionDate: 17.10.2012; ClassName: Artix
R53 = R0402_0R_JUMPER: Resistor; Part Description: 1A (0.05R Max DC Resistance) Zero Ohm Jumper; Manufacturer: GENERIC; Manufacturer1 Part Number: 232270591001L; PressFit: No; Part Number: R0402_0R_JUMPER; Component Kind: Standard; Component Type: Standard; Pin Count: 2; Value: 0; Status: Not Recommended; Manufacturer Part Number: R0402_0R_JUMPER; Case: 0402; Mounted: Yes; Sense: No; Socket: No; SMD: Yes; Manufacturer1 Example: YAGEO PHYCOMP; Manufacturer1 ComponentHeight: 0.4mm; HelpURL: \\cern.ch\dfs\Applications\Altium\Datasheets\R0402_Phycomp_RC0402.pdf; Author: CERN DEM JLC; CreateDate: 03.12.2007; LatestRevisionDate: 17.10.2012; ClassName: Artix
R55 = R0402_1k_1%_0.0625W_100PPM: Resistor - 1%; Part Description: General Purpose Thick Film Chip Resistor; Manufacturer: GENERIC; Manufacturer1 Part Number: 232270671002L; TC: ±100ppm/°C; PressFit: No; Part Number: R0402_1K_1%_0.0625W_100PPM; Component Kind: Standard; Component Type: Standard; Pin Count: 2; Value: 1k; Status: Not Recommended; Power: 0.0625W; Tolerance: ±1%; Manufacturer Part Number: R0402_1K_1%_0.0625W_100PPM; Case: 0402; Mounted: Yes; Sense: No; Socket: No; SMD: Yes; Manufacturer1 Example: YAGEO PHYCOMP; Manufacturer1 ComponentHeight: 0.4mm; HelpURL: \\cern.ch\dfs\Applications\Altium\Datasheets\R0402_Phycomp_RC0402.pdf; Author: CERN DEM JLC; CreateDate: 03.12.2007; LatestRevisionDate: 17.10.2012; ClassName: Artix
R57 = R0402_300R_1%_0.0625W_100PPM: Resistor - 1%; Part Description: General Purpose Thick Film Chip Resistor; Manufacturer: GENERIC; Manufacturer1 Part Number: 232270673001L; TC: ±100ppm/°C; PressFit: No; Part Number: R0402_300R_1%_0.0625W_100PPM; Component Kind: Standard; Component Type: Standard; Pin Count: 2; Value: 300; Status: Not Recommended; Power: 0.0625W; Tolerance: ±1%; Manufacturer Part Number: R0402_300R_1%_0.0625W_100PPM; Case: 0402; Mounted: Yes; Sense: No; Socket: No; SMD: Yes; Manufacturer1 Example: YAGEO PHYCOMP; Manufacturer1 ComponentHeight: 0.4mm; HelpURL: \\cern.ch\dfs\Applications\Altium\Datasheets\R0402_Phycomp_RC0402.pdf; Author: CERN DEM JLC; CreateDate: 03.12.2007; LatestRevisionDate: 17.10.2012
R58 = R0402_10K_1%_0.0625W_100PPM: Resistor - 1%; Part Description: General Purpose Thick Film Chip Resistor; Manufacturer: GENERIC; Manufacturer1 Part Number: 232270671003L; TC: ±100ppm/°C; PressFit: No; Part Number: R0402_10K_1%_0.0625W_100PPM; Component Kind: Standard; Component Type: Standard; Pin Count: 2; Value: 10k; Status: Not Recommended; Power: 0.0625W; Tolerance: ±1%; Manufacturer Part Number: R0402_10K_1%_0.0625W_100PPM; Case: 0402; Mounted: Yes; Sense: No; Socket: No; SMD: Yes; Manufacturer1 Example: YAGEO PHYCOMP; Manufacturer1 ComponentHeight: 0.4mm; HelpURL: \\cern.ch\dfs\Applications\Altium\Datasheets\R0402_Phycomp_RC0402.pdf; Author: CERN DEM JLC; CreateDate: 03.12.2007; LatestRevisionDate: 17.10.2012; ClassName: FPGA_JTAG
T4 = BSS138LT1G: N-CHANNEL MOSFET WITH DIODE; Part Description: 50V, 200mA N-Channel Enhancement Mode Field-Effect Transistor; Manufacturer: ON SEMICONDUCTOR; PressFit: No; Bonding: No; Part Number: BSS138LT1G; Component Kind: Standard; Component Type: Standard; Device: BSS138LT1G; PackageDescription: SOT23, 0.95mm Pitch; 3 Pin, 1.40mm W X 3.00mm L X 1.10mm H body, IPC Medium Density; Manufacturer Part Number: BSS138L; Pin Count: 3; Case: SOT23-3; Mounted: Yes; Socket: No; SMD: Yes; Sense: No; ComponentHeight: 1.11mm; HelpURL: \\cern.ch\dfs\Applications\Altium\Datasheets\BSS138LT1G.pdf; Author: CERN DEM JLC; CreateDate: 23.03.2009; LatestRevisionDate: 25.05.2022